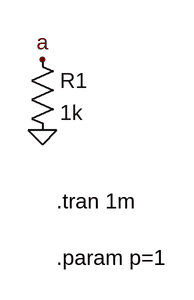
[diagram p0: schematic text_irregular_spacing.asc]
text_irregular_spacing.asc, the LTspice schematic file:
Version 4
SHEET 1 880 680
FLAG 16 96 0
FLAG 16 16 a
SYMBOL res 0 0 R0
SYMATTR InstName R1
SYMATTR Value 1k
TEXT  32 176	Left  2 !.tran 1m
TEXT 32 240 Left 2 !.param p=1

The netlist it stands for:
* text_irregular_spacing.asc
R1 a 0 1k
.tran 1m
.param p=1
.backanno
.end